# Altium project Design-v2.1.PrjPcb (part 2 of 2)

## Sheet Controller_Sheet.SchDoc
size A4; SheetNumber: 2; SheetTotal: 2
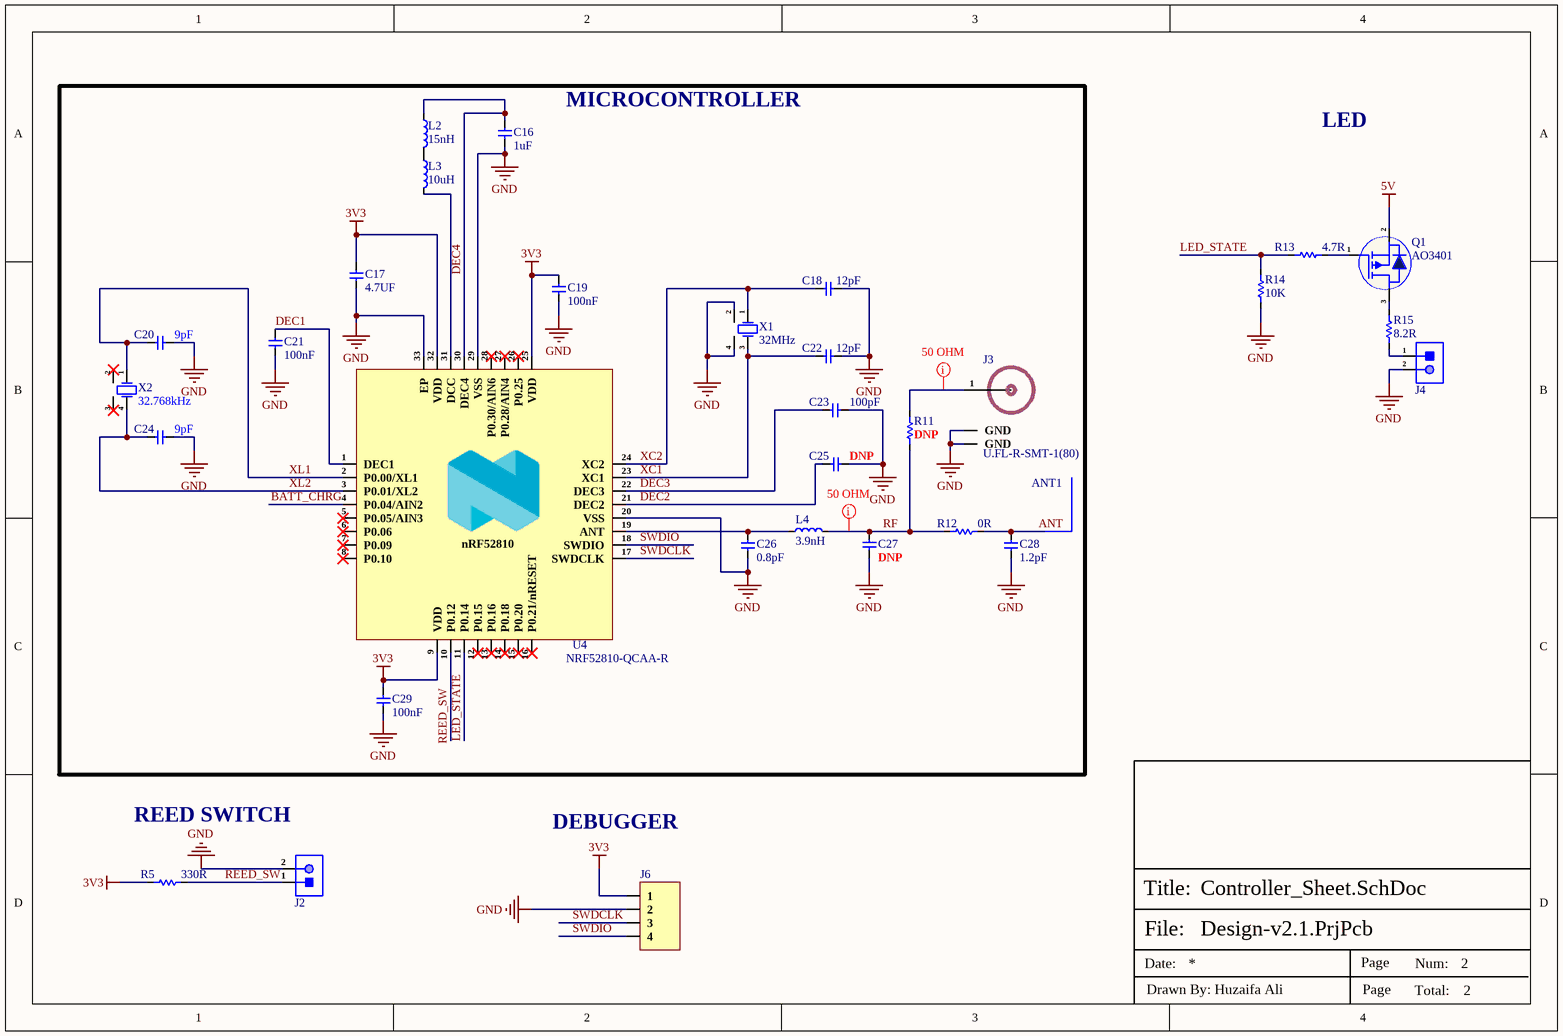
[diagram p1: Controller_Sheet.SchDoc]

### Parts
ANT1  NRF PCB Antenna  [NRF PCB ANTENNA]  (value not drawn)  (no BOM)
C16  1uF  [Cap-0402]
C17  4.7UF  [Cap-0603]
C18  12pF  [Cap-0402]
C19  100nF  [cap-0402]
C20  9pF  [Cap-0402]
C21  100nF  [cap-0402]
C22  12pF  [Cap-0402]
C23  100pF  [Cap-0402]
C24  9pF  [Cap-0402]
C25  DNP  [cap-0402]
C26  0.8pF  [Cap-0402]
C27  DNP  [cap-0402]
C28  1.2pF  [Cap-0402]
C29  100nF  [cap-0402]
J2  X6511WV-02H-C60D30  [HDR1X2_]  (value not drawn)
J3  U.FL-R-SMT-1(80)  [U.FL-R-SMT-1(80)_]
J4  TH_Pads_LED  [TH_Pads_LED]  (value not drawn)  (no BOM)
J6  POGO Connector 4 Pin  [Pogo 4 Pin]  (value not drawn)
L2  15nH  [IND-0402]
L3  10uH  [IND-0603 (1608 Metric)]
L4  3.9nH  [IND-0201]
Q1  AO3401  [SOT-23]
R5  330R  [Res-0603]
R11  DNP  [Res-0402]
R12  0R  [Res-0402]
R13  4.7R  [Res-0603]
R14  10K  [Res-0603]
R15  8.2R  [Res-1206]
U4  NRF52810-QCAA-R  [32-QFN (5x5)]
X1  32MHz  [SMD2016-4P]
X2  32.768kHz  [MC-146_]

### Blocks framed on the sheet
MICROCONTROLLER: ANT1 C16-C29 J3 L2-L4 R11 R12 U4 X1 X2

### Nets
3V3: C17.2 C19.2 C29.2 J6.1 R5.2 U4.9(VDD) U4.25(VDD) U4.32(VDD)
5V: Q1.2(S)
GND: C16.2 C17.1 C18.2 C19.1 C20.2 C21.1 C22.2 C23.2 C24.2 C25.1 C26.1 C27.2 C28.1 C29.1 J2.2 J3.2(GND) J3.3(GND) J4.2 J6.2 R14.1 U4.20(VSS) U4.29(VSS) U4.33(EP) X1.2(GND) X1.4(GND)
ANT: C28.2 R12.2
BATT_CHRG: U4.4(P0.04/AIN2)
DEC1: C21.2 U4.1(DEC1)
DEC2: C25.2 U4.21(DEC2)
DEC3: C23.1 U4.22(DEC3)
DEC4: C16.1 L2.1 U4.30(DEC4)
LED_STATE: R13.1 R14.2 U4.11(P0.14)
REED_SW: J2.1 R5.1 U4.10(P0.12)
RF: C27.1 L4.2 R11.1 R12.1
SWDCLK: J6.3 U4.17(SWDCLK)
SWDIO: J6.4 U4.18(SWDIO)
XC1: C22.1 U4.23(XC1) X1.3(OSC2)
XC2: C18.1 U4.24(XC2) X1.1(OSC1)
XL1: C20.1 U4.2(P0.00/XL1) X2.1(OSC1)
XL2: C24.1 U4.3(P0.01/XL2) X2.4(OSC2)
NetC26_2: C26.2 L4.1 U4.19(ANT)
NetJ3_1: J3.1(RF_IN) R11.2
NetJ4_1: J4.1 R15.1
NetL2_2: L2.2 L3.1
NetL3_2: L3.2 U4.31(DCC)
NetQ1_1: Q1.1(G) R13.2
NetQ1_3: Q1.3(D) R15.2

Not connected (* = marked no-connect by the designer): U4 5(P0.05/AIN3)* 6(P0.06)* 7(P0.09)* 8(P0.10)* 12(P0.15)* 13(P0.16)* 14(P0.18)* 15(P0.20)* 16(P0.21/nRESET)* 26(P0.25)* 27(P0.28/AIN4)* 28(P0.30/AIN6)*; X2 2(GND)* 3(GND)*

### Layout directives
rule Impedance Constraint [Min = 47.00    Max = 52.00    ]: NetJ3_1, RF

### Notes on the sheet
- LED
- REED SWITCH
- DEBUGGER
- File:
- Title:
- Date:
- Page
- Num:
- Total:
- Drawn By: Huzaifa Ali
- (in symbol NRF52810-QCAA-R) nRF52810

### Library data of the parts
ANT1 = NRF PCB Antenna: PCB Antenna
C16 = CL05A105KA5NQNC: CAP CER 1UF 25V X5R 0402; Manufacturer: Samsung; Material: Ceramic; Tolerance: 10%; Item Type: Capacitor; Supplier 1: Arrow Electronics; Manufacturer Part Number: CL05A105KA5NQNC; RoHS: Yes; Category: Ceramic Capacitors; Stock 1: 80000; Pricing 1: 10000=0.0256, 20000=0.0238, 30000=0.0228, 50000=0.0207, 100000=0.0175, 250000=0.0157 (USD); Mounting Technology: Surface Mount; Case/Package: 0402; Case Code (Metric): 1005; Case Code (Imperial): 0402; Min Operating Temperature: -55°C; Max Operating Temperature: 85°C; Package Quantity: 10000; Series: CL; Voltage Rating: 25V; Packaging: Tape and Reel; Construction: Flat; Value: 1uF; Dielectric: X5R; Length: 1mm; Width: 0.02inch; Height: 0.5mm; Depth: 0.5mm; Thickness: 0.022inch; Radiation Hardening: No; Lead Free: Lead Free; RoHS Compliant: Yes; ComponentLink1URL: https://datasheet.ciiva.com/25720/cl05a105ka5nqnc-25720771.pdf?src-supplier=Digi-Key; ComponentLink1Description: https://datasheet.ciiva.com/25720/cl05a105ka5nqnc-25720771.pdf?src-supplier=Digi-Key; ComponentLink2URL: https://datasheet.ciiva.com/3777/cl05a105ka5nqnc-3777709.pdf?src-supplier=Arrow+Electronics; ComponentLink2Description: https://datasheet.ciiva.com/3777/cl05a105ka5nqnc-3777709.pdf?src-supplier=Arrow+Electronics; ComponentLink3URL: https://datasheet.ciiva.com/29198/459147-da-01-en-vs-kondensator-0402-29198339.pdf?src-supplier=Conrad; ComponentLink3Description: https://datasheet.ciiva.com/29198/459147-da-01-en-vs-kondensator-0402-29198339.pdf?src-supplier=Conrad; Supplier Part Number 1: CL05A105KA5NQNC; LCSC Part Number: C52923
C17 = CL10A475KA8NQNC: CAP CER 4.7UF 25V X5R 0603; Manufacturer: Samsung; Tolerance: 10%; Supplier 1: Digi-Key; Manufacturer Part Number: CL10A475KA8NQNC; Stock 1: 2252340; Pricing 1: 1=0.37, 10=0.255, 100=0.1528, 500=0.11456, 1000=0.09675 (USD); Mount: Surface Mount; Case/Package: 0603; Case Code (Metric): 1608; Case Code (Imperial): 0603; Contact Plating: Tin; Min Operating Temperature: -55°C; Max Operating Temperature: 85°C; Package Quantity: 1; Packaging: Tape and Reel; Capacitance: 4.7uF; Voltage Rating: 25V; Dielectric: X5R; Termination: Wraparound; Length: 1.6mm; Width: 0.031inch; Thickness: 0.035inch; Depth: 0.8mm; Lead Free: Lead Free; ComponentLink1URL: http://www.samsungsem.com/kr/support/product-search/mlcc/CL10A475KA8NQNC.jsp?src-supplier=Digi-Key; ComponentLink1Description: http://www.samsungsem.com/kr/support/product-search/mlcc/CL10A475KA8NQNC.jsp?src-supplier=Digi-Key; Supplier Part Number 1: 1276-1900-1-ND; LCSC Part Number: C69335
C18 C22 = GJM1555C1H120GB01D: CAP CER 12PF 50V C0G/NP0 0402; Manufacturer: Murata; Tolerance: 2%; Dielectric: C0G; Supplier 1: Digi-Key; Manufacturer Part Number: GJM1555C1H120GB01D; RoHS: Yes; Category: Ceramic Capacitors; Stock 1: 266975; Pricing 1: 1=0.18000, 10=0.12600, 50=0.07560, 100=0.06390, 500=0.04370, 1000=0.03865, 2500=0.03698, 5000=0.03361 (USD); Mount: Surface Mount; Case/Package: 0402; Case Code (Imperial): 0402; Case Code (Metric): 1005; Min Operating Temperature: -55°C; Max Operating Temperature: 125°C; Capacitance: 12pF; Voltage Rating: 50V; Voltage Rating (DC): 50V; Packaging: Tape and Reel; Package Quantity: 10000; Termination: SMD/SMT; Series: GJM; Construction: Flat; Length: 1mm; Width: 0.5mm; Height: 0.5mm; Thickness: 0.022inch; Depth: 0.5mm; Radiation Hardening: No; Lead Free: Lead Free; RoHS Compliant: Yes; ComponentLink1URL: https://datasheet.ciiva.com/11608/product-11608208.pdf?src-supplier=Avnet; ComponentLink1Description: https://datasheet.ciiva.com/11608/product-11608208.pdf?src-supplier=Avnet; ComponentLink2URL: https://datasheet.ciiva.com/29542/partnumbering-e-01-29542716.pdf?src-supplier=Digi-Key; ComponentLink2Description: https://datasheet.ciiva.com/29542/partnumbering-e-01-29542716.pdf?src-supplier=Digi-Key; ComponentLink3URL: https://datasheet.ciiva.com/29542/partnumbering-e-01-29542715.pdf?src-supplier=Digi-Key; ComponentLink3Description: https://datasheet.ciiva.com/29542/partnumbering-e-01-29542715.pdf?src-supplier=Digi-Key; ComponentLink4URL: https://datasheet.ciiva.com/29542/partnumbering-e-01-29542717.pdf?src-supplier=Digi-Key; ComponentLink4Description: https://datasheet.ciiva.com/29542/partnumbering-e-01-29542717.pdf?src-supplier=Digi-Key; Supplier Part Number 1: 490-8078-1-ND; LCSC Part Number: C161305
C19 C21 C25 C27 C29 = C1005X7R1H104KT000F: CAP CER 0.1UF 50V X7R 0402; Manufacturer: TDK; Tolerance: 10%; Voltage: 25V; Item Type: Capacitor; Supplier 1: Avnet; Manufacturer Part Number: C1005X7R1H104KT000F; RoHS: No; Category: Ceramic Capacitors; Dielectric: X7R; Supplier Part Number 1: C1005X7R1H104KT000F; LCSC Part Number: C361198; ComponentLink1Description: LCSC; ComponentLink1URL: https://www.lcsc.com/product-detail/Multilayer-Ceramic-Capacitors-MLCC-SMD-SMT_TDK-C1005X7R1H104KT000F_C361198.html
C20 C24 = 0402CG9R0C500NT: 50V 9pF C0G 0402 Multilayer Ceramic Capacitors MLCC - SMD/SMT ROHS; Manufacturer: FH (Guangdong Fenghua Advanced Tech); Manufacturer Part Number: 0402CG9R0C500NT; Package: 0402; LCSC Part Number: C1580; Item Type: Capacitor; ComponentLink1Description: LCSC; ComponentLink1URL: https://www.lcsc.com/product-detail/Multilayer-Ceramic-Capacitors-MLCC-SMD-SMT_FH-Guangdong-Fenghua-Advanced-Tech-0402CG9R0C500NT_C1580.html
C23 = CC0402JRNPO9BN101: CAP CER 100PF 50V C0G/NPO 0402; Manufacturer: Yageo; Dielectric Material: Ceramic; Tolerance: 5%; Dielectric: C0G; Temperature Coefficient: 30ppm/°C; Insulation Resistance: 100GR; Item Type: Capacitor; Supplier: Future Electronics; Supplier Part Number: 8934564; Manufacturer Part Number: CC0402JRNPO9BN101; RoHS: Yes; Category: Ceramic Capacitors; Stock: 11720000; Pricing: 10000=0.002, 40000=0.0019, 150000=0.0018, 400000=0.0018, 1000000=0.0017 (USD); Mounting Technology: Surface Mount; Case/Package: 0402; Pins: 2; Case Code (Imperial): 0402; Case Code (Metric): 1005; Min Operating Temperature: -55°C; Max Operating Temperature: 125°C; Value: 100pF; Voltage Rating: 50V; Voltage Rating (DC): 50V; Packaging: Tape and Reel; Package Quantity: 1; Termination: SMD/SMT; Voltage: 50V; Series: CC; Length: 1mm; Width: 0.02inch; Height: 0.5mm; Thickness: 0.022inch; Depth: 0.5mm; Radiation Hardening: No; RoHS Compliant: Yes; Reach SVHC Compliant: No; Lead Free: Lead Free; ComponentLink1URL: https://datasheet.ciiva.com/11786/0900766b80d84fbf-11786101.pdf?src-supplier=Rs; ComponentLink1Description: https://datasheet.ciiva.com/11786/0900766b80d84fbf-11786101.pdf?src-supplier=Rs; ComponentLink2URL: https://datasheet.ciiva.com/23767/25787-23767888.pdf?src-supplier=Newark; ComponentLink2Description: https://datasheet.ciiva.com/23767/25787-23767888.pdf?src-supplier=Newark; ComponentLink3URL: https://datasheet.ciiva.com/28450/1443161-28450220.pdf?src-supplier=Element14; ComponentLink3Description: https://datasheet.ciiva.com/28450/1443161-28450220.pdf?src-supplier=Element14; ComponentLink4URL: https://datasheet.ciiva.com/8033/1443161-8033598.pdf?src-supplier=Element14; ComponentLink4Description: https://datasheet.ciiva.com/8033/1443161-8033598.pdf?src-supplier=Element14; ComponentLink5URL: https://datasheet.ciiva.com/143/mlccorderingcode-143990.pdf?src-supplier=Digi-Key; ComponentLink5Description: https://datasheet.ciiva.com/143/mlccorderingcode-143990.pdf?src-supplier=Digi-Key; ComponentLink6URL: https://datasheet.ciiva.com/143/mlccorderingcode-143989.pdf?src-supplier=Digi-Key; ComponentLink6Description: https://datasheet.ciiva.com/143/mlccorderingcode-143989.pdf?src-supplier=Digi-Key; ComponentLink7URL: https://datasheet.ciiva.com/143/mlccorderingcode-143991.pdf?src-supplier=Digi-Key; ComponentLink7Description: https://datasheet.ciiva.com/143/mlccorderingcode-143991.pdf?src-supplier=Digi-Key; LCSC Part Number: C106200
C26 = CC0402BRNPO9BNR80: CAP CER 0.8PF 50V C0G/NPO 0402; Manufacturer: Yageo; Dielectric: C0G; Item Type: Capacitor; Supplier: Future Electronics; Supplier Part Number: 4783825; Manufacturer Part Number: CC0402BRNPO9BNR80; RoHS: Yes; Category: Ceramic Capacitors; Stock: 70000; Pricing: 10000=0.0034, 40000=0.0032, 150000=0.0031, 250000=0.003, 500000=0.0028 (USD); Mounting Technology: Surface Mount; Case/Package: 0402; Case Code (Imperial): 0402; Case Code (Metric): 1005; Weight: 2.3E-05oz; Min Operating Temperature: -55°C; Max Operating Temperature: 125°C; Value: 0.8pF; Voltage Rating (DC): 50V; Packaging: Tape and Reel; Termination: SMD/SMT; Voltage Rating: 50V; Series: CC; Length: 0.039inch; Width: 0.02inch; Thickness: 0.022inch; RoHS Compliant: Yes; Halogen Free: 5694HalogenFree; Lead Free: 5697LeadFree; ComponentLink1URL: http://www.mouser.com/ds/2/447/Yageo_UPY-GP_NP0_16V-to-50V_9-358835.pdf?src-supplier=Mouser; ComponentLink1Description: http://www.mouser.com/ds/2/447/Yageo_UPY-GP_NP0_16V-to-50V_9-358835.pdf?src-supplier=Mouser; ComponentLink2URL: https://datasheet.octopart.com/CC0402BRNPO9BNR80-Yageo-datasheet-151948684.pdf?src-supplier=Newark; ComponentLink2Description: https://datasheet.octopart.com/CC0402BRNPO9BNR80-Yageo-datasheet-151948684.pdf?src-supplier=Newark; ComponentLink3URL: http://www.yageo.com/documents/recent/UPY-GP_NP0_16V-to-50V_16.pdf?src-supplier=Digikey; ComponentLink3Description: http://www.yageo.com/documents/recent/UPY-GP_NP0_16V-to-50V_16.pdf?src-supplier=Digikey; ComponentLink4URL: https://www.yageo.com/upload/media/product/productsearch/datasheet/mlcc/UPY-GP_NP0_16V-to-50V_18.pdf?src-supplier=Digikey; ComponentLink4Description: https://www.yageo.com/upload/media/product/productsearch/datasheet/mlcc/UPY-GP_NP0_16V-to-50V_18.pdf?src-supplier=Digikey; ComponentLink5URL: https://datasheet.octopart.com/CC0402BRNPO9BNR80-Yageo-datasheet-151948684.pdf?src-supplier=Farnell; ComponentLink5Description: https://datasheet.octopart.com/CC0402BRNPO9BNR80-Yageo-datasheet-151948684.pdf?src-supplier=Farnell; ComponentLink6URL: https://datasheet.octopart.com/CC0402BRNPO9BNR80-Yageo-datasheet-137875056.pdf?src-supplier=Future+Electronics; ComponentLink6Description: https://datasheet.octopart.com/CC0402BRNPO9BNR80-Yageo-datasheet-137875056.pdf?src-supplier=Future+Electronics; LCSC Part Number: C327032
C28 = CC0402BRNPO9BN1R2: CAP CER 1.2PF 50V C0G/NPO 0402; Manufacturer: Yageo; Item Type: Capacitor; Temperature Coefficient: 30ppm/°C; Supplier: Digikey; LCSC Part Number: C327292; Manufacturer Part Number: CC0402BRNPO9BN1R2; RoHS: Yes; Stock: 92678; Pricing: 1=0.1, 10=0.032, 50=0.0184, 100=0.0142, 500=0.01068, 1000=0.00839, 2500=0.00762, 5000=0.00702 (USD); Halogen Free: 5694HalogenFree; ComponentLink1URL: https://datasheet.ciiva.com/13386/upy-gp-np0-16v-to-50v-8-13386283.pdf?src-supplier=Mouser; ComponentLink1Description: https://datasheet.ciiva.com/13386/upy-gp-np0-16v-to-50v-8-13386283.pdf?src-supplier=Mouser; ComponentLink2URL: https://datasheet.ciiva.com/15189/getdatasheetpartid-468320-15189100.pdf?src-supplier=Verical; ComponentLink2Description: https://datasheet.ciiva.com/15189/getdatasheetpartid-468320-15189100.pdf?src-supplier=Verical; ComponentLink3URL: https://datasheet.ciiva.com/11587/upy-gp-np0-16v-to-50v-8-11587117.pdf?src-supplier=Avnet; ComponentLink3Description: https://datasheet.ciiva.com/11587/upy-gp-np0-16v-to-50v-8-11587117.pdf?src-supplier=Avnet
J2 = X6511WV-02H-C60D30: Gold 250V 3A Straight Square Pins 2.5mm 2P 260℃ 6mm -40℃~+105℃ 3mm 2.54mm Plugin Black Brass 1x2P Plugin,P=2.54mm Pin Headers ROHS; Manufacturer: XKB; Item Type: Male Header; Manufacturer Part Number: X6511WV-02H-C60D30; Package: Plugin,P=2.54mm; LCSC Part Number: C706874; ComponentLink1Description: LCSC; ComponentLink1URL: https://www.lcsc.com/product-detail/Pin-Headers_XKB-Connectivity-X6511WV-02H-C60D30_C706874.html
J3 = U.FL-R-SMT-1(80): CONN U.FL RCPT STR 50 OHM SMD; Manufacturer: Hirose; Item Type: UFL Connector; Supplier 1: Future Electronics; Manufacturer Part Number: U.FL-R-SMT-1(80); Stock 1: 1272; Pricing 1: 1=1.07, 500=0.785, 1500=0.74, 2500=0.72, 5000=0.695 (USD); Case/Package: SMD/SMT; Package Quantity: 10000; Packaging: Tape and Reel; Lead Free: Lead Free; ComponentLink1URL: https://www.hirose.com/product/en/download_file/key_name/U.FL-R-SMT-1%2880%29/category/Specification%20Sheet/doc_file_id/37638/?file_category_id=9&item_id=03310472280&is_series=&src-supplier=Digi-Key; ComponentLink1Description: https://www.hirose.com/product/en/download_file/key_name/U.FL-R-SMT-1%2880%29/category/Specification%20Sheet/doc_file_id/37638/?file_category_id=9&item_id=03310472280&is_series=&src-supplier=Digi-Key; ComponentLink2URL: http://www.mouser.com/ds/2/185/U.FL_catalog-939761.pdf?src-supplier=Mouser; ComponentLink2Description: http://www.mouser.com/ds/2/185/U.FL_catalog-939761.pdf?src-supplier=Mouser; Supplier Part Number 1: U.FL-R-SMT-1(80)-CUTT; LCSC Part Number: C88374
J4 = TH_Pads_LED: Wire Connecting Pads
J6 = POGO Connector 4 Pin: Pogo Pad 2.5mm 4 Pin; Item Type: Pogo Connector; Manufacturer Part Number: POGO Connector 4 Pin
L2 = LQG15HN15NJ02D: FIXED IND 15NH 400MA 0.45OHM SMD; Manufacturer: Murata; Item Type: Inductor; Core Material: Air; Current Rating: 300mA; Tolerance: 5%; Q Factor: 8; Self Resonant Frequency: 2.3GHz; Shielding: Unshielded; DC Resistance (DCR): 460mR; Test Frequency: 100MHz; ESR: 450mR; Supplier: Mouser; LCSC Part Number: C97979; Manufacturer Part Number: LQG15HN15NJ02D; RoHS: Yes; Stock: 45308; Pricing: 1=0.1, 10=0.037, 50=0.037, 100=0.029, 1000=0.022, 10000=0.018 (USD); Mounting Technology: Surface Mount; Case/Package: 0402; Case Code (Metric): 1005; Case Code (Imperial): 0402; Min Operating Temperature: -55°C; Max Operating Temperature: 125°C; Packaging: Tape and Reel; Package Quantity: 1; Termination: SMD/SMT; Series: LQG15HS; Inductance Tolerance: 5%; Value: 15nH; Max DC Current: 300mA; DC Current: 300mA; Max Current Rating: 300mA; Length: 0.039inch; Width: 0.02inch; Height: 0.5mm; Height - Seated (Max): 0.022inch; Depth: 0.55mm; Reach SVHC Compliant: No; RoHS Compliant: Yes; Military Standard: Not; ComponentLink1URL: https://datasheet.ciiva.com/11801/0900766b80f10808-11801397.pdf?src-supplier=Rs; ComponentLink1Description: https://datasheet.ciiva.com/11801/0900766b80f10808-11801397.pdf?src-supplier=Rs; ComponentLink2URL: https://datasheet.ciiva.com/8002/66026-8002488.pdf?src-supplier=Element14; ComponentLink2Description: https://datasheet.ciiva.com/8002/66026-8002488.pdf?src-supplier=Element14; ComponentLink3URL: https://datasheet.ciiva.com/29696/l0075s0083lqg15hn-29696702.pdf?src-supplier=Digikey; ComponentLink3Description: https://datasheet.ciiva.com/29696/l0075s0083lqg15hn-29696702.pdf?src-supplier=Digikey; ComponentLink4URL: https://datasheet.ciiva.com/1063/l0075s0083lqg15hn-1063850.pdf?src-supplier=Digikey; ComponentLink4Description: https://datasheet.ciiva.com/1063/l0075s0083lqg15hn-1063850.pdf?src-supplier=Digikey; ComponentLink5URL: https://datasheet.ciiva.com/29696/l0075s0083lqg15hn-29696703.pdf?src-supplier=Digikey; ComponentLink5Description: https://datasheet.ciiva.com/29696/l0075s0083lqg15hn-29696703.pdf?src-supplier=Digikey
L3 = LBMF1608T100K: FIXED IND 10UH 80MA 360 MOHM SMD; Manufacturer: Taiyo Yuden; Item Type: Inductors; Core Material: Ferrite; Self Resonant Frequency: 32MHz; Tolerance: 10%; Shielding: Unshielded; Test Frequency: 2.52MHz; DC Resistance (DCR): 360mR; ESR: 468mR; Supplier: Digikey; LCSC Part Number: C87216; Manufacturer Part Number: LBMF1608T100K; RoHS: Yes; Stock: 2726337; Pricing: 1=0.13, 10=0.103, 25=0.0936, 50=0.0866, 100=0.0802, 250=0.07256, 500=0.06724, 1000=0.0623 (USD); Mounting Technology: Surface Mount; Case/Package: 0603; Weight: 7.1E-05oz; Case Code (Metric): 1608; Case Code (Imperial): 0603; Min Operating Temperature: -40°C; Max Operating Temperature: 105°C; Packaging: Tape and Reel; Value: 10uH; Max DC Current: 80mA; Termination: SMD/SMT; Inductance Tolerance: 10%; DC Current: 80mA; Series: LB, MF Type; RMS Current (Irms): 80mA; Length: 1.6mm; Width: 0.8mm; Height: 0.35mm; Lead Pitch: 0.7mm; Depth: 0.9mm; Radiation Hardening: No; Military Standard: Not; RoHS Compliant: Yes; Reach SVHC Compliant: Unknown; ComponentLink1URL: https://datasheet.ciiva.com/26872/getdatasheetpartid-637440-26872437.pdf?src-supplier=Verical; ComponentLink1Description: https://datasheet.ciiva.com/26872/getdatasheetpartid-637440-26872437.pdf?src-supplier=Verical; ComponentLink2URL: https://datasheet.ciiva.com/15986/610lbmf1608t100k-15986589.pdf?src-supplier=Onlinecomponents.com; ComponentLink2Description: https://datasheet.ciiva.com/15986/610lbmf1608t100k-15986589.pdf?src-supplier=Onlinecomponents.com; ComponentLink3URL: https://datasheet.ciiva.com/1040/lbmf1608t100k-ss-1040360.pdf?src-supplier=Digikey; ComponentLink3Description: https://datasheet.ciiva.com/1040/lbmf1608t100k-ss-1040360.pdf?src-supplier=Digikey; ComponentLink4URL: https://datasheet.ciiva.com/8504/lbmf1608t100k-ss-8504740.pdf?src-supplier=Avnet; ComponentLink4Description: https://datasheet.ciiva.com/8504/lbmf1608t100k-ss-8504740.pdf?src-supplier=Avnet; ComponentLink5URL: https://datasheet.ciiva.com/46395/1497259-46395174.pdf?src-supplier=Element14; ComponentLink5Description: https://datasheet.ciiva.com/46395/1497259-46395174.pdf?src-supplier=Element14
L4 = LQP03TG3N9B02D: FIXED IND 3.9NH 350MA 350MOHM SM; Manufacturer: Murata; Item Type: Inductors; Shielding: Unshielded; DC Resistance (DCR): 350mR; Self Resonant Frequency: 6GHz; Test Frequency: 500MHz; Supplier: Digikey; LCSC Part Number: C86114; Manufacturer Part Number: LQP03TG3N9B02D; RoHS: Yes; Stock: 170; Pricing: 1=0.1, 10=0.025, 25=0.0224, 50=0.0208, 100=0.0193, 250=0.01748, 500=0.0162, 1000=0.01502, 2500=0.01358 (USD); Mounting Technology: Surface Mount; Case/Package: 0201; Min Operating Temperature: -55°C; Max Operating Temperature: 125°C; Package Quantity: 15000; Packaging: Tape and Reel; Current Rating: 350mA; Value: 3.9nH; Max DC Current: 350mA; DC Current: 350mA; Series: LQP03TG_02; Technology: THIN FILM; Length: 0.024inch; Width: 0.012inch; Height: 0.3mm; Height - Seated (Max): 0.013inch; Depth: 0.33mm; Military Standard: Not; RoHS Compliant: Yes; ComponentLink1URL: https://datasheet.ciiva.com/29691/jelf243c-0016-29691349.pdf?src-supplier=Digikey; ComponentLink1Description: https://datasheet.ciiva.com/29691/jelf243c-0016-29691349.pdf?src-supplier=Digikey
Q1 = AO3401: Trans Mosfet P-ch 30V 4A 3-PIN SOT-23 T/r; Manufacturer: Alpha & Omega Semiconductor; Manufacturer Part Number: AO3401A; Rds On Max: 44mR; Input Capacitance: 1.2nF; Max Power Dissipation: 1.4W; Number of Elements: 1; Supplier 1: Arrow Electronics; RoHS: Yes; Category: MOSFETs; Mount: Surface Mount; Case/Package: TO-236-3; Number of Pins: 3; Min Operating Temperature: -55°C; Max Operating Temperature: 150°C; Packaging: Tape and Reel; Drain to Source Voltage (Vdss): 30V; Continuous Drain Current (ID): 4A; Power Dissipation: 1.4W; Series: -; Radiation Hardening: No; RoHS Compliant: Yes; Lead Free: Lead Free; ComponentLink1URL: https://datasheet.ciiva.com/940/ao3401a-940720.pdf?src-supplier=Digi-Key; ComponentLink1Description: https://datasheet.ciiva.com/940/ao3401a-940720.pdf?src-supplier=Digi-Key; ComponentLink2URL: https://datasheet.ciiva.com/26927/getdatasheetpartid-79048-26927888.pdf?src-supplier=Verical; ComponentLink2Description: https://datasheet.ciiva.com/26927/getdatasheetpartid-79048-26927888.pdf?src-supplier=Verical; Supplier Part Number 1: AO3401A; LCSC Part Number: C181091; Item Type: Mosfet
R5 = RC0603JR-07330RL: RES  SMD 330R 100 mW 0603; Manufacturer: Yageo; Power Rating: 100mW; Tolerance: 5%; Voltage Rating (DC): 50V; Temperature Coefficient: 100ppm/°C; Item Type: Resistor; Supplier 1: Digi-Key; Manufacturer Part Number: RC0603JR-07330RL; RoHS: Yes; Category: Chip SMD Resistors; Stock 1: 1074593; Pricing 1: 1=0.10000, 10=0.02000, 100=0.00800, 1000=0.00360, 2500=0.00312 (USD); Case/Package: 0603; Number of Pins: 2; Case Code (Imperial): 0603; Case Code (Metric): 1608; Size Code: 0603; Min Operating Temperature: -55°C; Max Operating Temperature: 155°C; Resistance: 330R; Packaging: Tape and Reel; Voltage Rating: 50V; Package Quantity: 5000; Termination: SMD/SMT; Resistor Type: Thick Film; Features: Moisture Resistant; Series: RC; Max Power Dissipation: 100mW; Number of Terminations: 2; Resistance Tolerance: 5%; Construction: Rectangular; Length: 1.6mm; Width: 0.8mm; Height: 0.45mm; Depth: 0.8mm; REACH SVHC: No SVHC; Lead Free: Lead Free; Military Standard: Not; RoHS Compliant: Yes; Supplier Part Number 1: 311-330GRCT-ND; LCSC Part Number: C105879
R11 = RC0402FR-070RL: RES 0 OHM JUMPER 1/16W 0402; Manufacturer: Yageo; Item Type: Resistors; Resistance: 0R; Tolerance: 1%; Power Rating: 62.5mW; Voltage Rating: 50V; Temperature Coefficient: 200ppm/°C; Max Power Dissipation: 63mW; Supplier 1: Mouser; Manufacturer Part Number: RC0402FR-070RL; RoHS: Yes; Stock 1: 8556842; Pricing 1: 1=0.10000, 10=0.01400, 50=0.01400, 100=0.00600, 1000=0.00300, 5000=0.00200, 10000=0.00100 (USD); Mount: Surface Mount; Case/Package: 0402; Contact Plating: Tin,Matte; Case Code (Imperial): 0402; Case Code (Metric): 1005; Size Code: 0402; Min Operating Temperature: -55°C; Max Operating Temperature: 155°C; Resistor Type: Thick Film; Packaging: Tape and Reel; Termination: SMD/SMT; Features: Moisture Resistant; Series: RC; Number of Terminations: 2; Length: 1mm; Width: 0.5mm; Height: 0.35mm; Radiation Hardening: No; Lead Free: Lead Free; RoHS Compliant: Yes; ComponentLink1URL: https://datasheet.ciiva.com/8896/pyu-rc0402-51-rohs-l-6-8896149.pdf?src-supplier=Avnet; ComponentLink1Description: https://datasheet.ciiva.com/8896/pyu-rc0402-51-rohs-l-6-8896149.pdf?src-supplier=Avnet; ComponentLink2URL: https://datasheet.ciiva.com/16790/pyu-rc0402-51-rohs-l-6-r-16790444.pdf?src-supplier=Future+Electronics; ComponentLink2Description: https://datasheet.ciiva.com/16790/pyu-rc0402-51-rohs-l-6-r-16790444.pdf?src-supplier=Future+Electronics; Supplier Part Number 1: 603-RC0402FR-070RL; LCSC Part Number: C106231
R12 = RC0402FR-070RL: RES 0 OHM JUMPER 1/16W 0402; Manufacturer: Yageo; Item Type: Resistors; Tolerance: 1%; Power Rating: 62.5mW; Voltage Rating: 50V; Temperature Coefficient: 200ppm/°C; Max Power Dissipation: 63mW; Supplier 1: Mouser; Manufacturer Part Number: RC0402FR-070RL; RoHS: Yes; Stock 1: 8556842; Pricing 1: 1=0.10000, 10=0.01400, 50=0.01400, 100=0.00600, 1000=0.00300, 5000=0.00200, 10000=0.00100 (USD); Mount: Surface Mount; Case/Package: 0402; Contact Plating: Tin,Matte; Case Code (Imperial): 0402; Case Code (Metric): 1005; Size Code: 0402; Min Operating Temperature: -55°C; Max Operating Temperature: 155°C; Resistance: 0R; Resistor Type: Thick Film; Packaging: Tape and Reel; Termination: SMD/SMT; Features: Moisture Resistant; Series: RC; Number of Terminations: 2; Length: 1mm; Width: 0.5mm; Height: 0.35mm; Radiation Hardening: No; Lead Free: Lead Free; RoHS Compliant: Yes; ComponentLink1URL: https://datasheet.ciiva.com/8896/pyu-rc0402-51-rohs-l-6-8896149.pdf?src-supplier=Avnet; ComponentLink1Description: https://datasheet.ciiva.com/8896/pyu-rc0402-51-rohs-l-6-8896149.pdf?src-supplier=Avnet; ComponentLink2URL: https://datasheet.ciiva.com/16790/pyu-rc0402-51-rohs-l-6-r-16790444.pdf?src-supplier=Future+Electronics; ComponentLink2Description: https://datasheet.ciiva.com/16790/pyu-rc0402-51-rohs-l-6-r-16790444.pdf?src-supplier=Future+Electronics; Supplier Part Number 1: 603-RC0402FR-070RL; LCSC Part Number: C106231
R13 = RC0603FR-074R7L: RES 4.7 OHM 1% 1/10W 0603; Manufacturer: Yageo; Voltage Rating: 50V; Power Rating: 100mW; Temperature Coefficient: 200ppm/°C; Item Type: Resistor; Supplier 1: Future Electronics; Manufacturer Part Number: RC0603FR-074R7L; RoHS: Yes; Category: Chip SMD Resistors; Stock 1: 160000; Pricing 1: 5000=0.0036, 25000=0.0034, 125000=0.0032, 250000=0.0031, 750000=0.0029 (USD); Case/Package: 0603; Pins: 2; Case Code (Imperial): 0603; Case Code (Metric): 1608; Min Operating Temperature: -55°C; Max Operating Temperature: 155°C; Package Quantity: 5000; Value: 4.7R; Tolerance: 1%; Packaging: Tape and Reel; Voltage Rating (DC): 50V; Resistor Type: Thick Film; Number of Terminations: 2; Termination: SMD/SMT; Max Power Dissipation: 100mW; Features: Moisture Resistant; Series: RC; Resistance Tolerance: 1%; Length: 1.6mm; Width: 0.8mm; Height: 0.45mm; Lead Free: Lead Free; Reach SVHC Compliant: Unknown; ComponentLink1URL: https://datasheet.ciiva.com/46440/1868787-46440910.pdf?src-supplier=Element14; ComponentLink1Description: https://datasheet.ciiva.com/46440/1868787-46440910.pdf?src-supplier=Element14; ComponentLink2URL: https://datasheet.ciiva.com/12555/rc0603-272842-12555071.pdf?src-supplier=Mouser; ComponentLink2Description: https://datasheet.ciiva.com/12555/rc0603-272842-12555071.pdf?src-supplier=Mouser; Supplier Part Number 1: 3598901; LCSC Part Number: C137705
R14 = RC0603FR-0710KL: RES SMD 10K Ohm 1% 1/10W 0603; Manufacturer: Yageo; Resistance: 10kR; Temperature Coefficient: 100ppm/°C; Voltage Rating (DC): 50V; Power Rating: 100mW; Voltage Rating: 75V; Item Type: Resistor; Supplier 1: Digi-Key; Manufacturer Part Number: RC0603FR-0710KL; RoHS: Yes; Category: Chip SMD Resistors; Stock 1: 25249139; Pricing 1: 1=0.10000, 10=0.02400, 100=0.00970, 1000=0.00436, 2500=0.00378 (USD); Case/Package: 0603; Number of Pins: 2; Case Code (Imperial): 0603; Case Code (Metric): 1608; Weight: 7.1E-05oz; Size Code: 0603; Min Operating Temperature: -55°C; Max Operating Temperature: 155°C; Tolerance: 1%; Resistor Type: Thick Film; Packaging: Tape and Reel; Termination: SMD/SMT; Features: Moisture Resistant; Series: RC; Max Power Dissipation: 100mW; Number of Terminations: 2; Resistance Tolerance: 1%; Construction: Rectangular; Length: 1.6mm; Width: 0.8mm; Height: 0.45mm; Depth: 0.8mm; Lead Pitch: 0.3mm; REACH SVHC: Unknown; Lead Free: Lead Free; Military Standard: Not; RoHS Compliant: Yes; ComponentLink1URL: https://datasheet.ciiva.com/7660/38590-7660789.pdf?src-supplier=Element14; ComponentLink1Description: https://datasheet.ciiva.com/7660/38590-7660789.pdf?src-supplier=Element14; ComponentLink2URL: https://datasheet.ciiva.com/7983/443971-7983596.pdf?src-supplier=Element14; ComponentLink2Description: https://datasheet.ciiva.com/7983/443971-7983596.pdf?src-supplier=Element14; ComponentLink3URL: https://datasheet.ciiva.com/22747/443971-22747519.pdf?src-supplier=Element14; ComponentLink3Description: https://datasheet.ciiva.com/22747/443971-22747519.pdf?src-supplier=Element14; ComponentLink4URL: https://datasheet.ciiva.com/46440/1868787-46440891.pdf?src-supplier=Element14; ComponentLink4Description: https://datasheet.ciiva.com/46440/1868787-46440891.pdf?src-supplier=Element14; ComponentLink5URL: https://datasheet.ciiva.com/7746/1738695-7746239.pdf?src-supplier=Element14; ComponentLink5Description: https://datasheet.ciiva.com/7746/1738695-7746239.pdf?src-supplier=Element14; ComponentLink6URL: https://datasheet.ciiva.com/15189/getdatasheetpartid-409289-15189591.pdf?src-supplier=Verical; ComponentLink6Description: https://datasheet.ciiva.com/15189/getdatasheetpartid-409289-15189591.pdf?src-supplier=Verical; Supplier Part Number 1: 311-10.0KHRCT-ND; LCSC Part Number: C98220
R15 = RC1206FR-078R2L: RES 8.2 OHM 1% 1/4W 1206; Manufacturer: Yageo; Item Type: Resistors; Voltage Rating (AC): 200V; Supplier: Digikey; Supplier Part Number: 311-8.20FRCT-ND; Manufacturer Part Number: RC1206FR-078R2L; RoHS: Yes; Stock: 39560; Pricing: 1=0.13, 10=0.064, 50=0.0426, 100=0.0364, 500=0.02612, 1000=0.023 (USD); ComponentLink1URL: https://datasheet.ciiva.com/11809/0900766b80c6630a-11809543.pdf?src-supplier=Rs; ComponentLink1Description: https://datasheet.ciiva.com/11809/0900766b80c6630a-11809543.pdf?src-supplier=Rs; ComponentLink2URL: https://datasheet.ciiva.com/2460/pyu-rc1206-51-rohs-l-4-2460129.pdf?src-supplier=Digikey; ComponentLink2Description: https://datasheet.ciiva.com/2460/pyu-rc1206-51-rohs-l-4-2460129.pdf?src-supplier=Digikey; ComponentLink3URL: https://datasheet.ciiva.com/2460/pyu-rc1206-51-rohs-l-4-2460130.pdf?src-supplier=Digikey; ComponentLink3Description: https://datasheet.ciiva.com/2460/pyu-rc1206-51-rohs-l-4-2460130.pdf?src-supplier=Digikey; ComponentLink4URL: https://datasheet.ciiva.com/2460/pyu-rc1206-51-rohs-l-4-2460131.pdf?src-supplier=Digikey; ComponentLink4Description: https://datasheet.ciiva.com/2460/pyu-rc1206-51-rohs-l-4-2460131.pdf?src-supplier=Digikey; LCSC Part Number: C488973
U4 = NRF52810-QCAA-R: IC RF TXRX+MCU BLE 32QFN; Manufacturer: Nordic Semiconductor; Supplier: Digikey; LCSC Part Number: C519278; Manufacturer Part Number: NRF52810-QCAA-R; RoHS: Yes; Item Type: IC; Stock: 11942; Pricing: 1=2.26, 100=1.92, 500=1.67, 1000=1.52 (USD); RoHS Compliant: Yes
X1 = Q22FA12800025: CRYSTAL 32.0000MHZ 8PF SMD; Manufacturer: Epson; Supplier: Farnell; LCSC Part Number: C187794; Manufacturer Part Number: Q22FA12800025; RoHS: Yes; Item Type: Crystal; Stock: 250; Pricing: 250=0.511 (GBP); ComponentLink1URL: http://ndap3-net.ebz.epson.co.jp/w/www/PDFS/epdoc_qd.nsf/85a4e2c523a1f89349257068002f9e30/255cb2884010a1f9492571f0004c7d72/$FILE/FA-128_E09X.pdf?src-supplier=Newark; ComponentLink1Description: http://ndap3-net.ebz.epson.co.jp/w/www/PDFS/epdoc_qd.nsf/85a4e2c523a1f89349257068002f9e30/255cb2884010a1f9492571f0004c7d72/$FILE/FA-128_E09X.pdf?src-supplier=Newark; ComponentLink2URL: http://www.farnell.com/datasheets/1734615.pdf?src-supplier=Newark; ComponentLink2Description: http://www.farnell.com/datasheets/1734615.pdf?src-supplier=Newark
X2 = Q13MC14620001: 32.768kHz 7pF ±20ppm MC-146 Crystals ROHS; Manufacturer: Seiko Epson; Manufacturer Part Number: Q13MC14620001; Package: MC-146; LCSC Part Number: C3013800; Item Type: Crystals; ComponentLink1Description: LCSC; ComponentLink1URL: https://www.lcsc.com/product-detail/Crystals_Seiko-span-style-background-color-ff0-Epson-span-Q13MC14620001_C3013800.html

## Nets that join several sheets
3V3: Power_Sheet (C14.2 C15.2 U3.2 U3.4), Controller_Sheet (8 pins)
5V: Power_Sheet (9 pins), Controller_Sheet (Q1.2)
GND: Power_Sheet (30 pins), Controller_Sheet (25 pins)
BATT_CHRG: Power_Sheet (D3.2 R9.2 R10.2 U2.8), Controller_Sheet (U4.4)